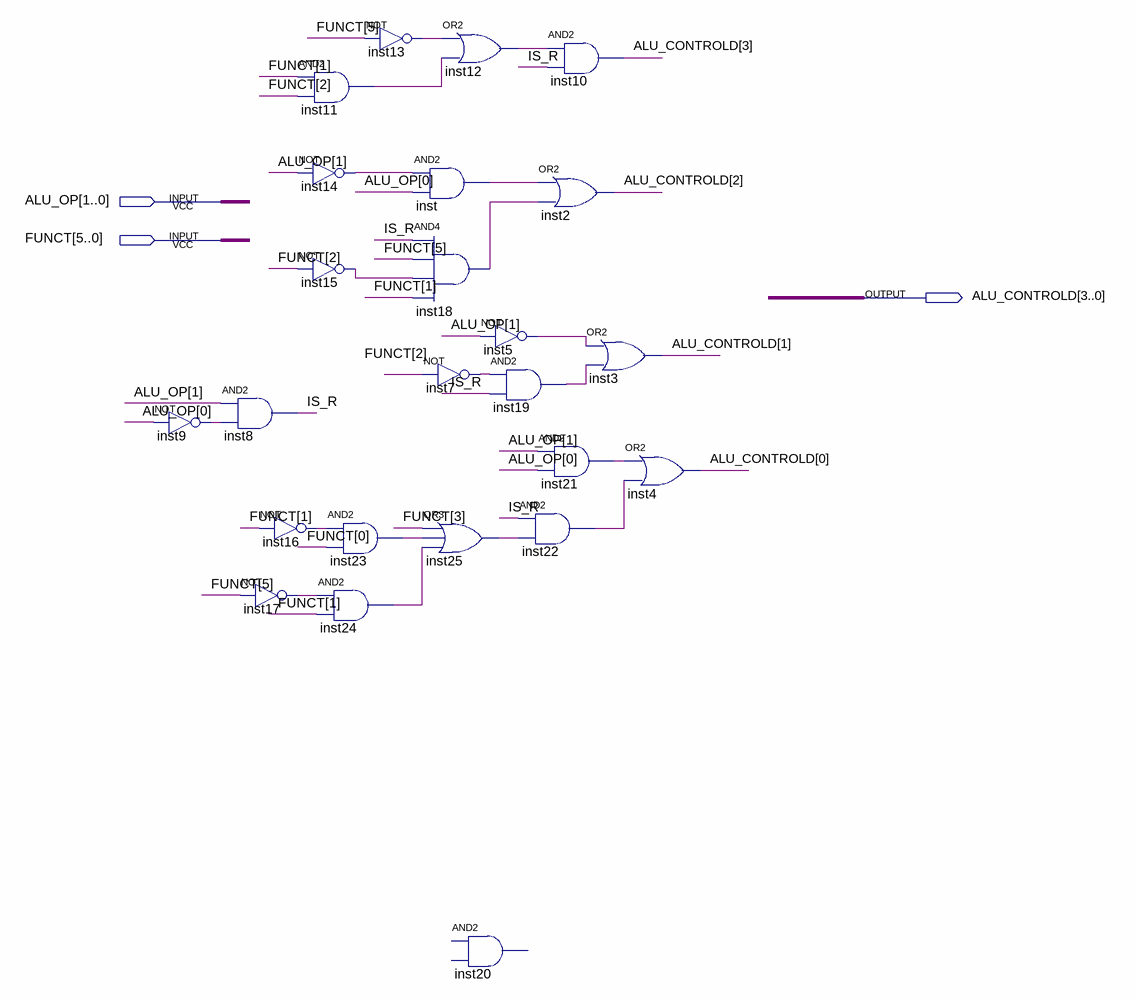
[diagram p0: schematic sheet]
// Quartus schematic ALU_DECODER.bdf as structural Verilog: 24 symbols, 3 pins
module ALU_DECODER (
  input  [1:0] ALU_OP,
  input  [5:0] FUNCT,
  output [3:0] ALU_CONTROLD
);

  wire inst5_out, inst7_out, inst9_out, inst11_out, inst12_out, inst13_out, inst14_out, inst15_out,
       inst16_out, inst17_out, inst18_out, inst19_out, inst21_out, inst22_out, inst23_out, inst24_out,
       inst25_out, inst_out, IS_R;

  not inst9 (inst9_out, ALU_OP[0]);
  and inst8 (IS_R, ALU_OP[1], inst9_out);
  not inst16 (inst16_out, FUNCT[1]);
  not inst17 (inst17_out, FUNCT[5]);
  not inst13 (inst13_out, FUNCT[5]);
  and inst11 (inst11_out, FUNCT[1], FUNCT[2]);
  not inst14 (inst14_out, ALU_OP[1]);
  not inst15 (inst15_out, FUNCT[2]);
  and inst23 (inst23_out, inst16_out, FUNCT[0]);
  and inst24 (inst24_out, inst17_out, FUNCT[1]);
  or inst12 (inst12_out, inst13_out, inst11_out);
  and inst (inst_out, inst14_out, ALU_OP[0]);
  and inst18 (inst18_out, IS_R, FUNCT[5], inst15_out, FUNCT[1]);
  not inst7 (inst7_out, FUNCT[2]);
  or inst25 (inst25_out, FUNCT[3], inst23_out, inst24_out);
  not inst5 (inst5_out, ALU_OP[1]);
  and inst19 (inst19_out, inst7_out, IS_R);
  and inst22 (inst22_out, IS_R, inst25_out);
  // AND2 inst20 is placed but not wired
  and inst10 (ALU_CONTROLD[3], inst12_out, IS_R);
  or inst2 (ALU_CONTROLD[2], inst_out, inst18_out);
  or inst3 (ALU_CONTROLD[1], inst5_out, inst19_out);
  and inst21 (inst21_out, ALU_OP[1], ALU_OP[0]);
  or inst4 (ALU_CONTROLD[0], inst21_out, inst22_out);
endmodule
